# Altium project bloo.PrjPcb
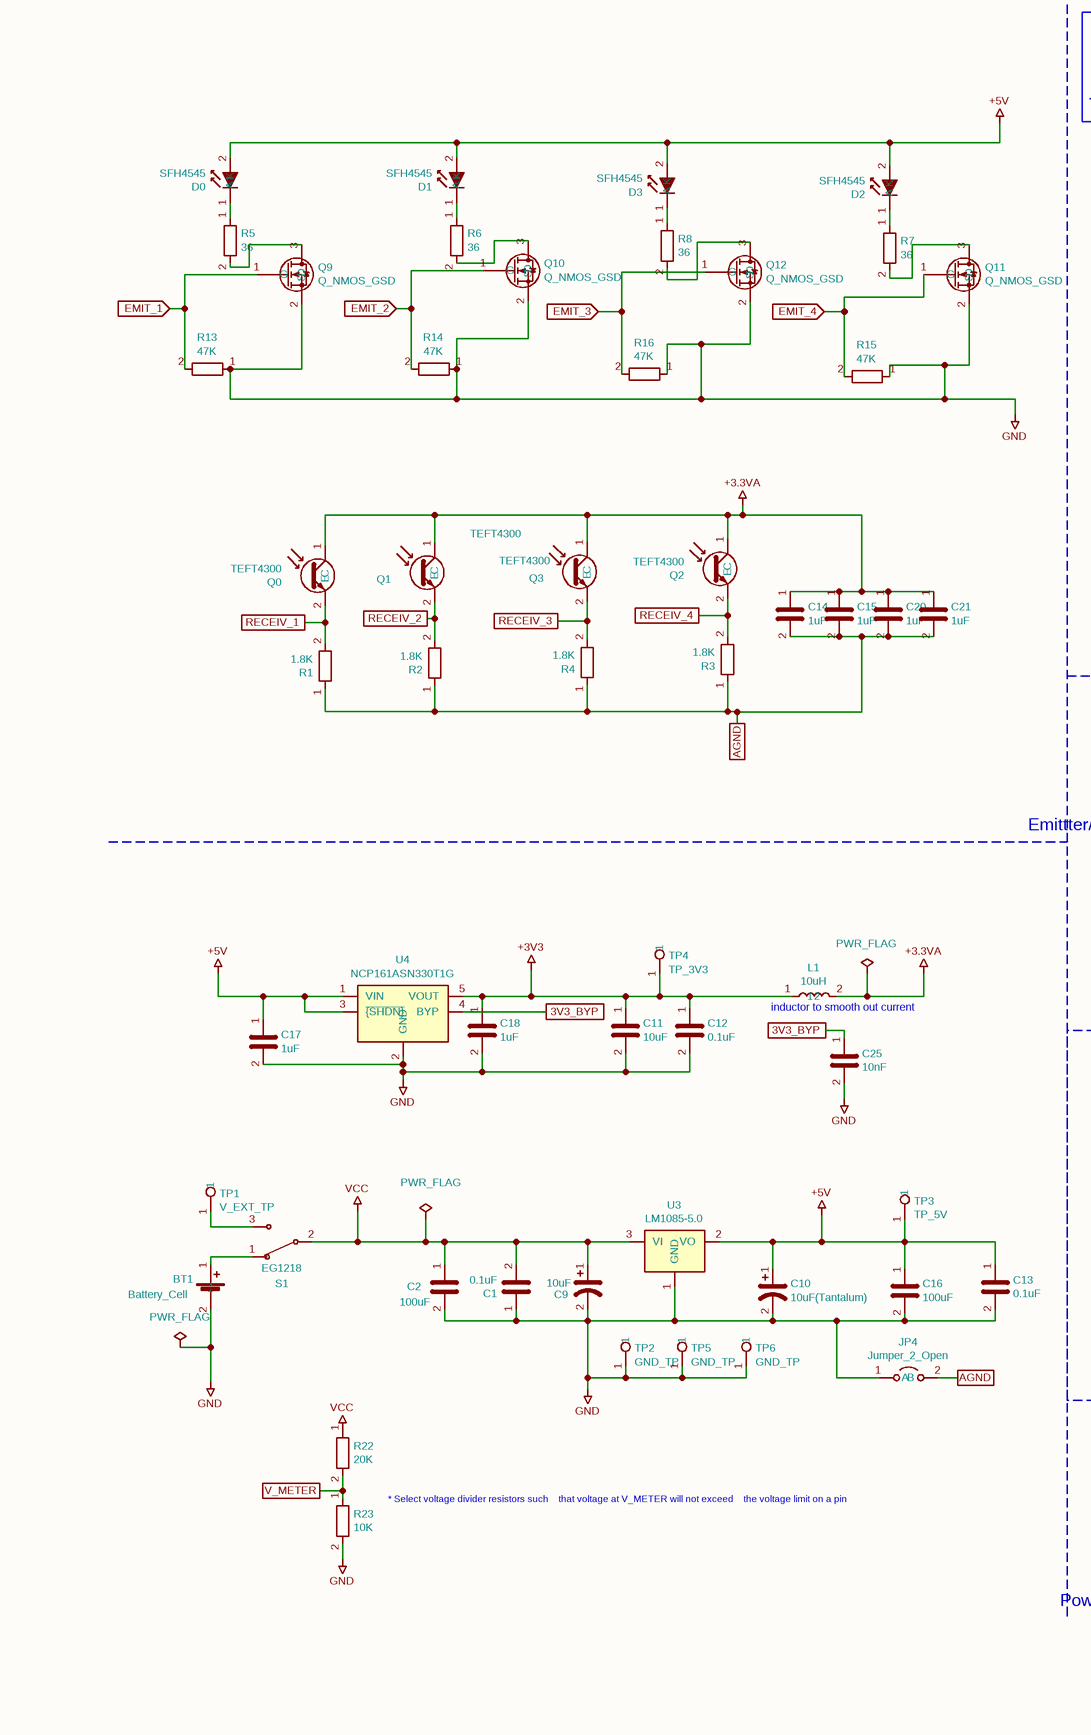
[diagram p0: bloo.SchDoc, left]
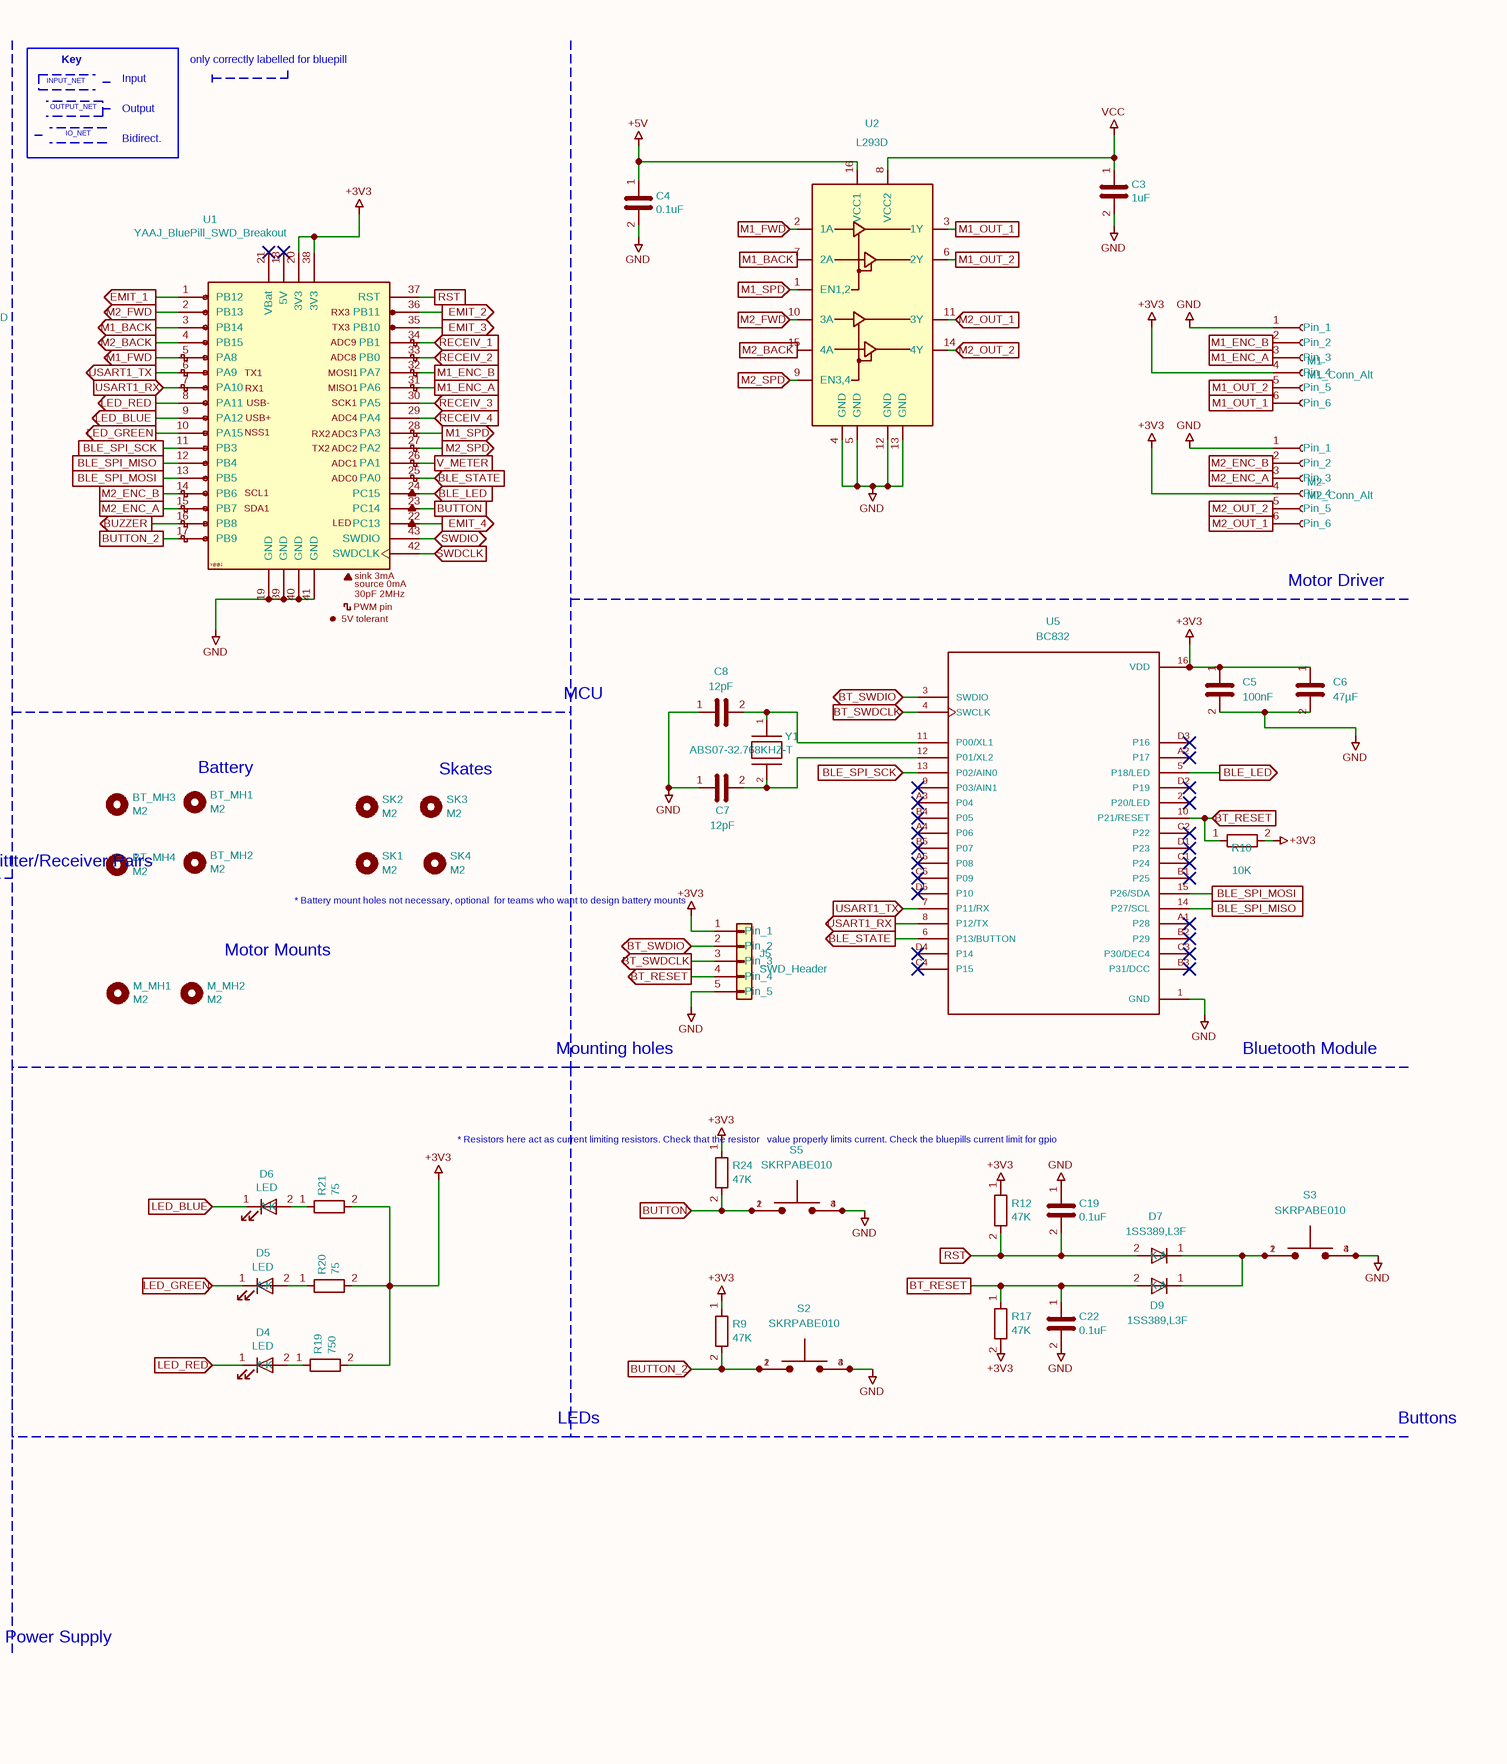
[diagram p1: bloo.SchDoc, right]
1 sheet, 97 parts. Net scope: flat (ports and power ports of the same name join across sheets).
Board file: bloo.PcbDoc

## Sheet bloo.SchDoc
size 420 x 297 mm

### Parts
#FLG01  PWR_FLAG  (graphical)
#FLG02  PWR_FLAG  (graphical)
#FLG03  PWR_FLAG  (graphical)
BT1  Battery_Cell  [AMASS_XT30UPB-M_1x02_P5.0mm_Vertical]
BT_MH1  M2  [MountingHole_2.2mm_M2]
BT_MH2  M2  [MountingHole_2.2mm_M2]
BT_MH3  M2  [MountingHole_2.2mm_M2]
BT_MH4  M2  [MountingHole_2.2mm_M2]
C1  0.1uF  [C_1206_3216Metric_Pad1.33x1.80mm_HandSolder]
C2  100uF  [CP_Radial_D6.3mm_P2.50mm]
C3  1uF  [C_1206_3216Metric_Pad1.33x1.80mm_HandSolder]
C4  0.1uF  [C_1206_3216Metric_Pad1.33x1.80mm_HandSolder]
C5  100nF  [C_0603_1608Metric]
C6  47µF  [C_1206_3216Metric]
C7  12pF  [C_0603_1608Metric_Pad1.08x0.95mm_HandSolder]
C8  12pF  [C_0603_1608Metric_Pad1.08x0.95mm_HandSolder]
C9  10uF  [C_1206_3216Metric_Pad1.33x1.80mm_HandSolder]
C10  10uF(Tantalum)  [C_1206_3216Metric_Pad1.33x1.80mm_HandSolder]
C11  10uF  [C_1206_3216Metric_Pad1.33x1.80mm_HandSolder]
C12  0.1uF  [C_1206_3216Metric_Pad1.33x1.80mm_HandSolder]
C13  0.1uF  [C_1206_3216Metric_Pad1.33x1.80mm_HandSolder]
C14  1uF  [C_1206_3216Metric_Pad1.33x1.80mm_HandSolder]
C15  1uF  [C_1206_3216Metric_Pad1.33x1.80mm_HandSolder]
C16  100uF  [CP_Radial_D6.3mm_P2.50mm]
C17  1uF  [C_1206_3216Metric_Pad1.33x1.80mm_HandSolder]
C18  1uF  [C_1206_3216Metric_Pad1.33x1.80mm_HandSolder]
C19  0.1uF  [C_1206_3216Metric_Pad1.33x1.80mm_HandSolder]
C20  1uF  [C_1206_3216Metric_Pad1.33x1.80mm_HandSolder]
C21  1uF  [C_1206_3216Metric_Pad1.33x1.80mm_HandSolder]
C22  0.1uF  [C_1206_3216Metric_Pad1.33x1.80mm_HandSolder]
C25  10nF  [C_1206_3216Metric_Pad1.33x1.80mm_HandSolder]
D0  SFH4545  [Emitter]
D1  SFH4545  [Emitter]
D2  SFH4545  [Emitter]
D3  SFH4545  [Emitter]
D4  LED  [LED_0805_2012Metric_Pad1.15x1.40mm_HandSolder]
D5  LED  [LED_0805_2012Metric_Pad1.15x1.40mm_HandSolder]
D6  LED  [LED_0805_2012Metric_Pad1.15x1.40mm_HandSolder]
D7  1SS389,L3F  [D_SOD-523]
D9  1SS389,L3F  [D_SOD-523]
J5  SWD_Header  [PinHeader_1x05_P2.54mm_Vertical]
JP4  Jumper_2_Open  [SolderJumper-2_P1.3mm_Bridged_Pad1.0x1.5mm]
L1  10uH  [L_1206_3216Metric_Pad1.42x1.75mm_HandSolder]
M1  M1_Conn_Alt  [JST_SH_BM06B-SRSS-TB_1x06-1MP_P1.00mm_Vertical]
M2  M2_Conn_Alt  [JST_SH_BM06B-SRSS-TB_1x06-1MP_P1.00mm_Vertical]
M_MH1  M2  [Motor_mouse]
M_MH2  M2  [Motor_mouse]
Q0  TEFT4300  [Emitter]
Q1  TEFT4300  [Emitter]
Q2  TEFT4300  [Emitter]
Q3  TEFT4300  [Emitter]
Q9  Q_NMOS_GSD  [SOT-23]
Q10  Q_NMOS_GSD  [SOT-23]
Q11  Q_NMOS_GSD  [SOT-23]
Q12  Q_NMOS_GSD  [SOT-23]
R1  1.8K  [R_1206_3216Metric_Pad1.30x1.75mm_HandSolder]
R2  1.8K  [R_1206_3216Metric_Pad1.30x1.75mm_HandSolder]
R3  1.8K  [R_1206_3216Metric_Pad1.30x1.75mm_HandSolder]
R4  1.8K  [R_1206_3216Metric_Pad1.30x1.75mm_HandSolder]
R5  36  [R_1206_3216Metric_Pad1.30x1.75mm_HandSolder]
R6  36  [R_1206_3216Metric_Pad1.30x1.75mm_HandSolder]
R7  36  [R_1206_3216Metric_Pad1.30x1.75mm_HandSolder]
R8  36  [R_1206_3216Metric_Pad1.30x1.75mm_HandSolder]
R9  47K  [R_1206_3216Metric_Pad1.30x1.75mm_HandSolder]
R10  10K  [R_1206_3216Metric_Pad1.30x1.75mm_HandSolder]
R12  47K  [R_1206_3216Metric_Pad1.30x1.75mm_HandSolder]
R13  47K  [R_1206_3216Metric_Pad1.30x1.75mm_HandSolder]
R14  47K  [R_1206_3216Metric_Pad1.30x1.75mm_HandSolder]
R15  47K  [R_1206_3216Metric_Pad1.30x1.75mm_HandSolder]
R16  47K  [R_1206_3216Metric_Pad1.30x1.75mm_HandSolder]
R17  47K  [R_1206_3216Metric_Pad1.30x1.75mm_HandSolder]
R19  750  [R_1206_3216Metric_Pad1.30x1.75mm_HandSolder]
R20  75  [R_1206_3216Metric_Pad1.30x1.75mm_HandSolder]
R21  75  [R_1206_3216Metric_Pad1.30x1.75mm_HandSolder]
R22  20K  [R_1206_3216Metric_Pad1.30x1.75mm_HandSolder]
R23  10K  [R_1206_3216Metric_Pad1.30x1.75mm_HandSolder]
R24  47K  [R_1206_3216Metric_Pad1.30x1.75mm_HandSolder]
S1  EG1218  [MM Switch]
S2  SKRPABE010  [SW4_SKRPABE010_ALPS]
S3  SKRPABE010  [SW4_SKRPABE010_ALPS]
S5  SKRPABE010  [SW4_SKRPABE010_ALPS]
SK1  M2  [MountingHole_2.2mm_M2]
SK2  M2  [MountingHole_2.2mm_M2]
SK3  M2  [MountingHole_2.2mm_M2]
SK4  M2  [MountingHole_2.2mm_M2]
TP1  V_EXT_TP  [PinHeader_1x01_P2.54mm_Vertical]
TP2  GND_TP  [PinHeader_1x01_P2.54mm_Vertical]
TP3  TP_5V  [PinHeader_1x01_P2.54mm_Vertical]
TP4  TP_3V3  [PinHeader_1x01_P2.54mm_Vertical]
TP5  GND_TP  [PinHeader_1x01_P2.54mm_Vertical]
TP6  GND_TP  [PinHeader_1x01_P2.54mm_Vertical]
U1  YAAJ_BluePill_SWD_Breakout  [STM32F103]
U2  L293D  [DIP-16_W7.62mm]
U3  LM1085-5.0  [5V Voltage Reg]
U4  NCP161ASN330T1G  [SOT-23-5]
U5  BC832  [XCVR_BC832]
Y1  ABS07-32.768KHZ-T  [CAP_ABS07-32.768KHZ-T_ABR]

### Ports
3V3_BYP, AGND, BLE_LED (in), BLE_LED (out), BLE_SPI_MISO, BLE_SPI_MOSI, BLE_SPI_SCK, BLE_SPI_SCK (in), BLE_STATE (in), BLE_STATE (out), BT_RESET, BT_RESET (in), BT_RESET (out), BT_SWDCLK (in), BT_SWDCLK (out), BT_SWDIO (bidir), BUTTON, BUTTON (in), BUTTON_2, BUTTON_2 (in), BUZZER (out), EMIT_1 (in), EMIT_1 (out), EMIT_2 (in), EMIT_2 (out), EMIT_3 (in), EMIT_3 (out), EMIT_4 (in), EMIT_4 (out), LED_BLUE (in), LED_BLUE (out), LED_GREEN (in), LED_GREEN (out), LED_RED (in), LED_RED (out), M1_BACK (in), M1_BACK (out), M1_ENC_A, M1_ENC_B, M1_FWD (in), M1_FWD (out), M1_OUT_1, M1_OUT_2, M1_SPD (in), M1_SPD (out), M2_BACK (in), M2_BACK (out), M2_ENC_A, M2_ENC_B, M2_FWD (in), M2_FWD (out), M2_OUT_1, M2_OUT_1 (in), M2_OUT_2, M2_OUT_2 (in), M2_SPD (in), M2_SPD (out), RECEIV_1, RECEIV_1 (in), RECEIV_2, RECEIV_2 (in), RECEIV_3, RECEIV_3 (in), RECEIV_4, RECEIV_4 (in), RST, RST (in), SWDCLK (in), SWDIO (bidir), USART1_RX (in), USART1_RX (out), USART1_TX (in), USART1_TX (out), V_METER

### Nets
+3.3VA: #FLG02.1 C14.1 C15.1 C20.1 C21.1 L1.2 Q0.1(C) Q1.1(C) Q2.1(C) Q3.1(C)
+3V3: C5.1 C6.1 C11.1 C12.1 C18.1 J5.1(Pin_1) L1.1 M1.4(Pin_4) M2.4(Pin_4) R9.1 R10.2 R12.1 R17.2 R19.2 R20.2 R21.2 R24.1 TP4.1 U1.20(3V3) U1.38(3V3) U4.5(VOUT) U5.16(VDD)
+5V: C4.1 C10.1 C13.1 C16.1 C17.1 D0.2(A) D1.2(A) D2.2(A) D3.2(A) TP3.1 U2.16(VCC1) U3.2(VO) U4.1(VIN) U4.3(~{{SHDN}})
GND: #FLG03.1 BT1.2(-) C1.1 C2.2 C3.2 C4.2 C5.2 C6.2 C7.1 C8.1 C9.2 C10.2 C11.2 C12.2 C13.2 C16.2 C17.2 C18.2 C19.1 C22.2 C25.2 J5.5(Pin_5) JP4.1(A) M1.1(Pin_1) M2.1(Pin_1) Q9.2(S) Q10.2(S) Q11.2(S) Q12.2(S) R13.1 R14.1 R15.1 R16.1 R23.2 S2.3 S2.4 S3.3 S3.4 S5.3 S5.4 TP2.1 TP5.1 TP6.1 U1.19(GND) U1.39(GND) U1.40(GND) U1.41(GND) U2.4(GND) U2.5(GND) U2.12(GND) U2.13(GND) U3.1(GND) U4.2(GND) U5.1(GND)
VCC: #FLG01.1 C1.2 C2.1 C3.1 C9.1 R22.1 S1.2 U2.8(VCC2) U3.3(VI)
3V3_BYP: C25.1 U4.4(BYP) ; port 3V3_BYP
AGND: C14.2 C15.2 C20.2 C21.2 JP4.2(B) R1.1 R2.1 R3.1 R4.1 ; port AGND
BLE_LED: U1.24(PC15) U5.5(P18/LED) ; port BLE_LED
BLE_SPI_MISO: U1.12(PB4) U5.14(P27/SCL) ; port BLE_SPI_MISO
BLE_SPI_MOSI: U1.13(PB5) U5.15(P26/SDA) ; port BLE_SPI_MOSI
BLE_SPI_SCK: U1.11(PB3) U5.13(P02/AIN0) ; port BLE_SPI_SCK
BLE_STATE: U1.25(PA0) U5.6(P13/BUTTON) ; port BLE_STATE
BT_RESET: C22.1 D9.2(A) J5.4(Pin_4) R10.1 R17.1 U5.10(P21/RESET) ; port BT_RESET
BT_SWDCLK: J5.3(Pin_3) U5.4(SWCLK) ; port BT_SWDCLK
BT_SWDIO: J5.2(Pin_2) U5.3(SWDIO) ; port BT_SWDIO
BUTTON: R24.2 S5.1 S5.2 U1.23(PC14) ; port BUTTON
BUTTON_2: R9.2 S2.1 S2.2 U1.17(PB9) ; port BUTTON_2
BUZZER: U1.16(PB8) ; port BUZZER
EMIT_1: Q9.1(G) R13.2 U1.1(PB12) ; port EMIT_1
EMIT_2: Q10.1(G) R14.2 U1.36(PB11) ; port EMIT_2
EMIT_3: Q12.1(G) R16.2 U1.35(PB10) ; port EMIT_3
EMIT_4: Q11.1(G) R15.2 U1.22(PC13) ; port EMIT_4
LED_BLUE: D6.1(K) U1.9(PA12) ; port LED_BLUE
LED_GREEN: D5.1(K) U1.10(PA15) ; port LED_GREEN
LED_RED: D4.1(K) U1.8(PA11) ; port LED_RED
M1_BACK: U1.3(PB14) U2.7(2A) ; port M1_BACK
M1_ENC_A: M1.3(Pin_3) U1.31(PA6) ; port M1_ENC_A
M1_ENC_B: M1.2(Pin_2) U1.32(PA7) ; port M1_ENC_B
M1_FWD: U1.5(PA8) U2.2(1A) ; port M1_FWD
M1_OUT_1: M1.6(Pin_6) U2.3(1Y) ; port M1_OUT_1
M1_OUT_2: M1.5(Pin_5) U2.6(2Y) ; port M1_OUT_2
M1_SPD: U1.28(PA3) U2.1(EN1,2) ; port M1_SPD
M2_BACK: U1.4(PB15) U2.15(4A) ; port M2_BACK
M2_ENC_A: M2.3(Pin_3) U1.15(PB7) ; port M2_ENC_A
M2_ENC_B: M2.2(Pin_2) U1.14(PB6) ; port M2_ENC_B
M2_FWD: U1.2(PB13) U2.10(3A) ; port M2_FWD
M2_OUT_1: M2.6(Pin_6) U2.11(3Y) ; port M2_OUT_1
M2_OUT_2: M2.5(Pin_5) U2.14(4Y) ; port M2_OUT_2
M2_SPD: U1.27(PA2) U2.9(EN3,4) ; port M2_SPD
RECEIV_1: Q0.2(E) R1.2 U1.34(PB1) ; port RECEIV_1
RECEIV_2: Q1.2(E) R2.2 U1.33(PB0) ; port RECEIV_2
RECEIV_3: Q3.2(E) R4.2 U1.30(PA5) ; port RECEIV_3
RECEIV_4: Q2.2(E) R3.2 U1.29(PA4) ; port RECEIV_4
RST: C19.2 D7.2(A) R12.2 U1.37(RST) ; port RST
SWDCLK: U1.42(SWDCLK) ; port SWDCLK
SWDIO: U1.43(SWDIO) ; port SWDIO
USART1_RX: U1.7(PA10) U5.8(P12/TX) ; port USART1_RX
USART1_TX: U1.6(PA9) U5.7(P11/RX) ; port USART1_TX
V_METER: R22.2 R23.1 U1.26(PA1) ; port V_METER
NetBT1_1: BT1.1(+) S1.1
NetC7_2: C7.2 U5.12(P01/XL2) Y1.2
NetC8_2: C8.2 U5.11(P00/XL1) Y1.1
NetD0_1: D0.1(K) R5.1
NetD1_1: D1.1(K) R6.1
NetD2_1: D2.1(K) R7.1
NetD3_1: D3.1(K) R8.1
NetD4_2: D4.2(A) R19.1
NetD5_2: D5.2(A) R20.1
NetD6_2: D6.2(A) R21.1
NetD7_1: D7.1(K) D9.1(K) S3.1 S3.2
NetQ9_3: Q9.3(D) R5.2
NetQ10_3: Q10.3(D) R6.2
NetQ11_3: Q11.3(D) R7.2
NetQ12_3: Q12.3(D) R8.2
NetS1_3: S1.3 TP1.1

Not connected (* = marked no-connect by the designer): U1 18(5V)* 21(VBat)*; U5 2(P20/LED)* 9(P03/AIN1)* A1(P28)* A2(P17)* A3(P04)* A4(P06)* A5(P08)* B1(P25)* B2(P29)* B3(P31/DCC)* B4(P05)* B5(P07)* C1(P24)* C2(P22)* C3(P30/DEC4)* C4(P15)* C5(P09)* D1(P23)* D2(P19)* D3(P16)* D4(P14)* D5(P10)*

### Notes on the sheet
- INPUT_NET
- Key
- Input
- only correctly labelled for bluepill
- OUTPUT_NET
- IO_NET
- Output
- Bidirect.
- (near M2) Motor Driver
- MCU
- (near BT_MH1) Battery
- (near SK3) Skates
- (near BT_MH4) Emittter/Receiver Pairs
- * Battery mount holes not necessary, optional
  for teams who want to design battery mounts
- (near M_MH2) Motor Mounts
- (near L1) inductor to smooth out current
- Mounting holes
- Bluetooth Module
- (near R24) * Resistors here act as current limiting resistors. Check that the resistor
  value properly limits current. Check the bluepills current limit for gpio
- LEDs
- Buttons
- * Select voltage divider resistors such
  that voltage at V_METER will not exceed
  the voltage limit on a pin
- Power Supply
- 1
- 2
- 3
- 4
- 5
- 6
- 7
- 8
- A
- B
- C
- D
- E
- Title:
- File: bloo.kicad_sch
- Sheet: /
- F
- KiCad E.D.A.  kicad (5.1.4)-1
- Size: A3
- Date:
- Rev:
- Id: 1/1
- (in symbol YAAJ_BluePill_SWD_Breakout) RX3; TX3; ADC9; ADC8; TX1; MOSI1; RX1; MISO1; USB-; SCK1; USB+; ADC4; NSS1; RX2; ADC3; TX2; ADC2; ADC1; ADC0; SCL1; SDA1; LED; Y@@J; sink 3mA; source 0mA; 30pF 2MHz; PWM pin; 5V tolerant

### Library data of the parts
BT1 = Battery_Cell-Device-mouse_v2-rescue: LCSC Part #: C99101; Value: Battery_Cell; Footprint: Connector_AMASS:AMASS_XT30UPB-M_1x02_P5.0mm_Vertical
BT_MH1-BT_MH4 M_MH1 M_MH2 SK1-SK4 = MountingHole-Mechanical-mouse_v2-rescue: Value: M2
  BT_MH1-BT_MH4 SK1-SK4: Footprint: MountingHole:MountingHole_2.2mm_M2
  M_MH1 M_MH2: Footprint: MM_Library:Motor_mouse
C1-C8 C11-C22 C25 = C
  C1 C4 C12 C13 C19 C22: LCSC Part #: C1945; Value: 0.1uF; Footprint: Capacitor_SMD:C_1206_3216Metric_Pad1.33x1.80mm_HandSolder
  C2 C16: LCSC Part #: C1590882; Value: 100uF; Footprint: Capacitor_THT:CP_Radial_D6.3mm_P2.50mm
  C3 C14 C15 C17 C18 C20 C21: LCSC Part #: C28322; Value: 1uF; Footprint: Capacitor_SMD:C_1206_3216Metric_Pad1.33x1.80mm_HandSolder
  C5: LCSC Part #: C1590; Value: 100nF; Footprint: Capacitor_SMD:C_0603_1608Metric
  C6: LCSC Part #: C68361; Value: 47µF; Footprint: Capacitor_SMD:C_1206_3216Metric
  C7 C8: LCSC Part #: C38523; Value: 12pF; Footprint: Capacitor_SMD:C_0603_1608Metric_Pad1.08x0.95mm_HandSolder
  C11: LCSC Part #: C39127; Value: 10uF; Footprint: Capacitor_SMD:C_1206_3216Metric_Pad1.33x1.80mm_HandSolder
  C25: LCSC Part #: C1846; Value: 10nF; Footprint: Capacitor_SMD:C_1206_3216Metric_Pad1.33x1.80mm_HandSolder
C9 C10 = CP1-Device-mouse_v2-rescue: Footprint: Capacitor_SMD:C_1206_3216Metric_Pad1.33x1.80mm_HandSolder
  C9: LCSC Part #: C39127; Value: 10uF
  C10: LCSC Part #: C1952791; Value: 10uF(Tantalum)
D0-D3 = IRL81A-LED-mouse_v2-rescue: LCSC Part #: C2900370; Value: SFH4545; Footprint: MM_Library:Emitter
D4-D6 = LED-Device-mouse_v2-rescue: Value: LED; Footprint: LED_SMD:LED_0805_2012Metric_Pad1.15x1.40mm_HandSolder
  D4: LCSC Part #: C5879380
  D5: LCSC Part #: C2890404
  D6: LCSC Part #: C2293
D7 D9 = 1N4148WT: Sim.Device: D; Sim.Pins: 1=K 2=A; LCSC Part #: C516855; Value: 1SS389,L3F; Footprint: Diode_SMD:D_SOD-523
J5 = Conn_01x05: Value: SWD_Header; Footprint: Connector_PinHeader_2.54mm:PinHeader_1x05_P2.54mm_Vertical
L1 = L: LCSC Part #: C845121; Value: 10uH; Footprint: Inductor_SMD:L_1206_3216Metric_Pad1.42x1.75mm_HandSolder
M1 M2 = Conn_01x06_Female: LCSC Part #: C144397; Footprint: Connector_JST:JST_SH_BM06B-SRSS-TB_1x06-1MP_P1.00mm_Vertical
  M1: Value: M1_Conn_Alt
  M2: Value: M2_Conn_Alt
Q0-Q3 = Q_Photo_NPN-Device-mouse_v2-rescue: LCSC Part #: C118301; Value: TEFT4300; Footprint: MM_Library:Emitter
R1-R8 R13-R16 R19-R21 = R-Device-mouse_v2-rescue: Footprint: Resistor_SMD:R_1206_3216Metric_Pad1.30x1.75mm_HandSolder
  R1-R4: LCSC Part #: C22108; Value: 1.8K
  R5-R8: LCSC Part #: C18006; Value: 36
  R13-R16: LCSC Part #: C25664; Value: 47K
  R19: LCSC Part #: C17985; Value: 750
  R20 R21: LCSC Part #: C17987; Value: 75
R9 R10 R12 R17 R22-R24 = R: Footprint: Resistor_SMD:R_1206_3216Metric_Pad1.30x1.75mm_HandSolder
  R9 R12 R17 R24: LCSC Part #: C25664; Value: 47K
  R10 R23: LCSC Part #: C2479071; Value: 10K
  R22: LCSC Part #: C18003; Value: 20K
S1 = EG1218-dk_Slide-Switches-mouse-rescue: DK_Detail_Page: /product-detail/en/e-switch/EG1218/EG1903-ND/101726; Digi-Key_PN: EG1903-ND; MPN: EG1218; Category: Switches; Family: Slide Switches; DK_Datasheet_Link: http://spec_sheets.e-switch.com/specs/P040040.pdf; Manufacturer: E-Switch; Status: Active; LCSC Part #: C6689036; Value: EG1218; Footprint: MM_Library:MM Switch
S2 S3 S5 = SKRPABE010_1: MANUFACTURER: Alps; STANDARD: Manufacturer Recommendations; MAXIMUM_PACKAGE_HEIGHT: 2.5 mm; LCSC Part #: C778166; Value: SKRPABE010; Footprint: MM_Library:SW4_SKRPABE010_ALPS
TP1-TP6 = TestPoint: Footprint: Connector_PinHeader_2.54mm:PinHeader_1x01_P2.54mm_Vertical
  TP1: Value: V_EXT_TP
  TP2 TP5 TP6: Value: GND_TP
  TP3: Value: TP_5V
  TP4: Value: TP_3V3
U3 = LM1084-5.0-Regulator_Linear-mouse_v2-rescue: LCSC Part #: C129950; Value: LM1085-5.0; Footprint: MM_Library:5V Voltage Reg
U4 = APE8865Y5-33-HF-3: LCSC Part #: C892187; Value: NCP161ASN330T1G; Footprint: Package_TO_SOT_SMD:SOT-23-5
U5 = BC832: MF: Fanstel Corp.; Description_1: Bluetooth Bluetooth v5.0 Transceiver Module 2.4GHz Integrated, Chip Surface Mount; MAXIMUM_PACKAGE_HEIGHT: 1.3 mm; Package: Module Fanstel Corp.; Price: None; Check_prices: https://www.snapeda.com/parts/BC832/Fanstel/view-part/?ref=eda; STANDARD: Manufacturer Recommendations; PARTREV: 2.02; SnapEDA_Link: https://www.snapeda.com/parts/BC832/Fanstel/view-part/?ref=snap; MP: BC832; Purchase-URL: https://www.snapeda.com/api/url_track_click_mouser/?unipart_id=2754499&manufacturer=Fanstel Corp.&part_name=BC832&search_term=bc832; Availability: In Stock; MANUFACTURER: Fanstel Corp.; Value: BC832; Footprint: MM_Library:XCVR_BC832
Y1 = ABS07-32.768KHZ-T: MANUFACTURER: Abracon; PARTREV: 08.19.15; STANDARD: Manufacturer Recommendations; MAXIMUM_PACKAGE_HEIGHT: 0.9 mm; LCSC Part #: C130253; Value: ABS07-32.768KHZ-T; Footprint: MM_Library:CAP_ABS07-32.768KHZ-T_ABR
#FLG01 #FLG02 #FLG03 = PWR_FLAG: Value: PWR_FLAG
JP4 = Jumper_2_Open: Value: Jumper_2_Open; Footprint: Jumper:SolderJumper-2_P1.3mm_Bridged_Pad1.0x1.5mm
Q9-Q12 = Q_NMOS_GSD: LCSC Part #: C5310967; Value: Q_NMOS_GSD; Footprint: Package_TO_SOT_SMD:SOT-23
U1 = YAAJ_BluePill_SWD_Breakout: Value: YAAJ_BluePill_SWD_Breakout; Footprint: MM_Library:STM32F103
U2 = L293D: LCSC Part #: C12340; Value: L293D; Footprint: Package_DIP:DIP-16_W7.62mm